# Altium project DIO_8SMA_8MCX.PrjPCB (part 4 of 4)
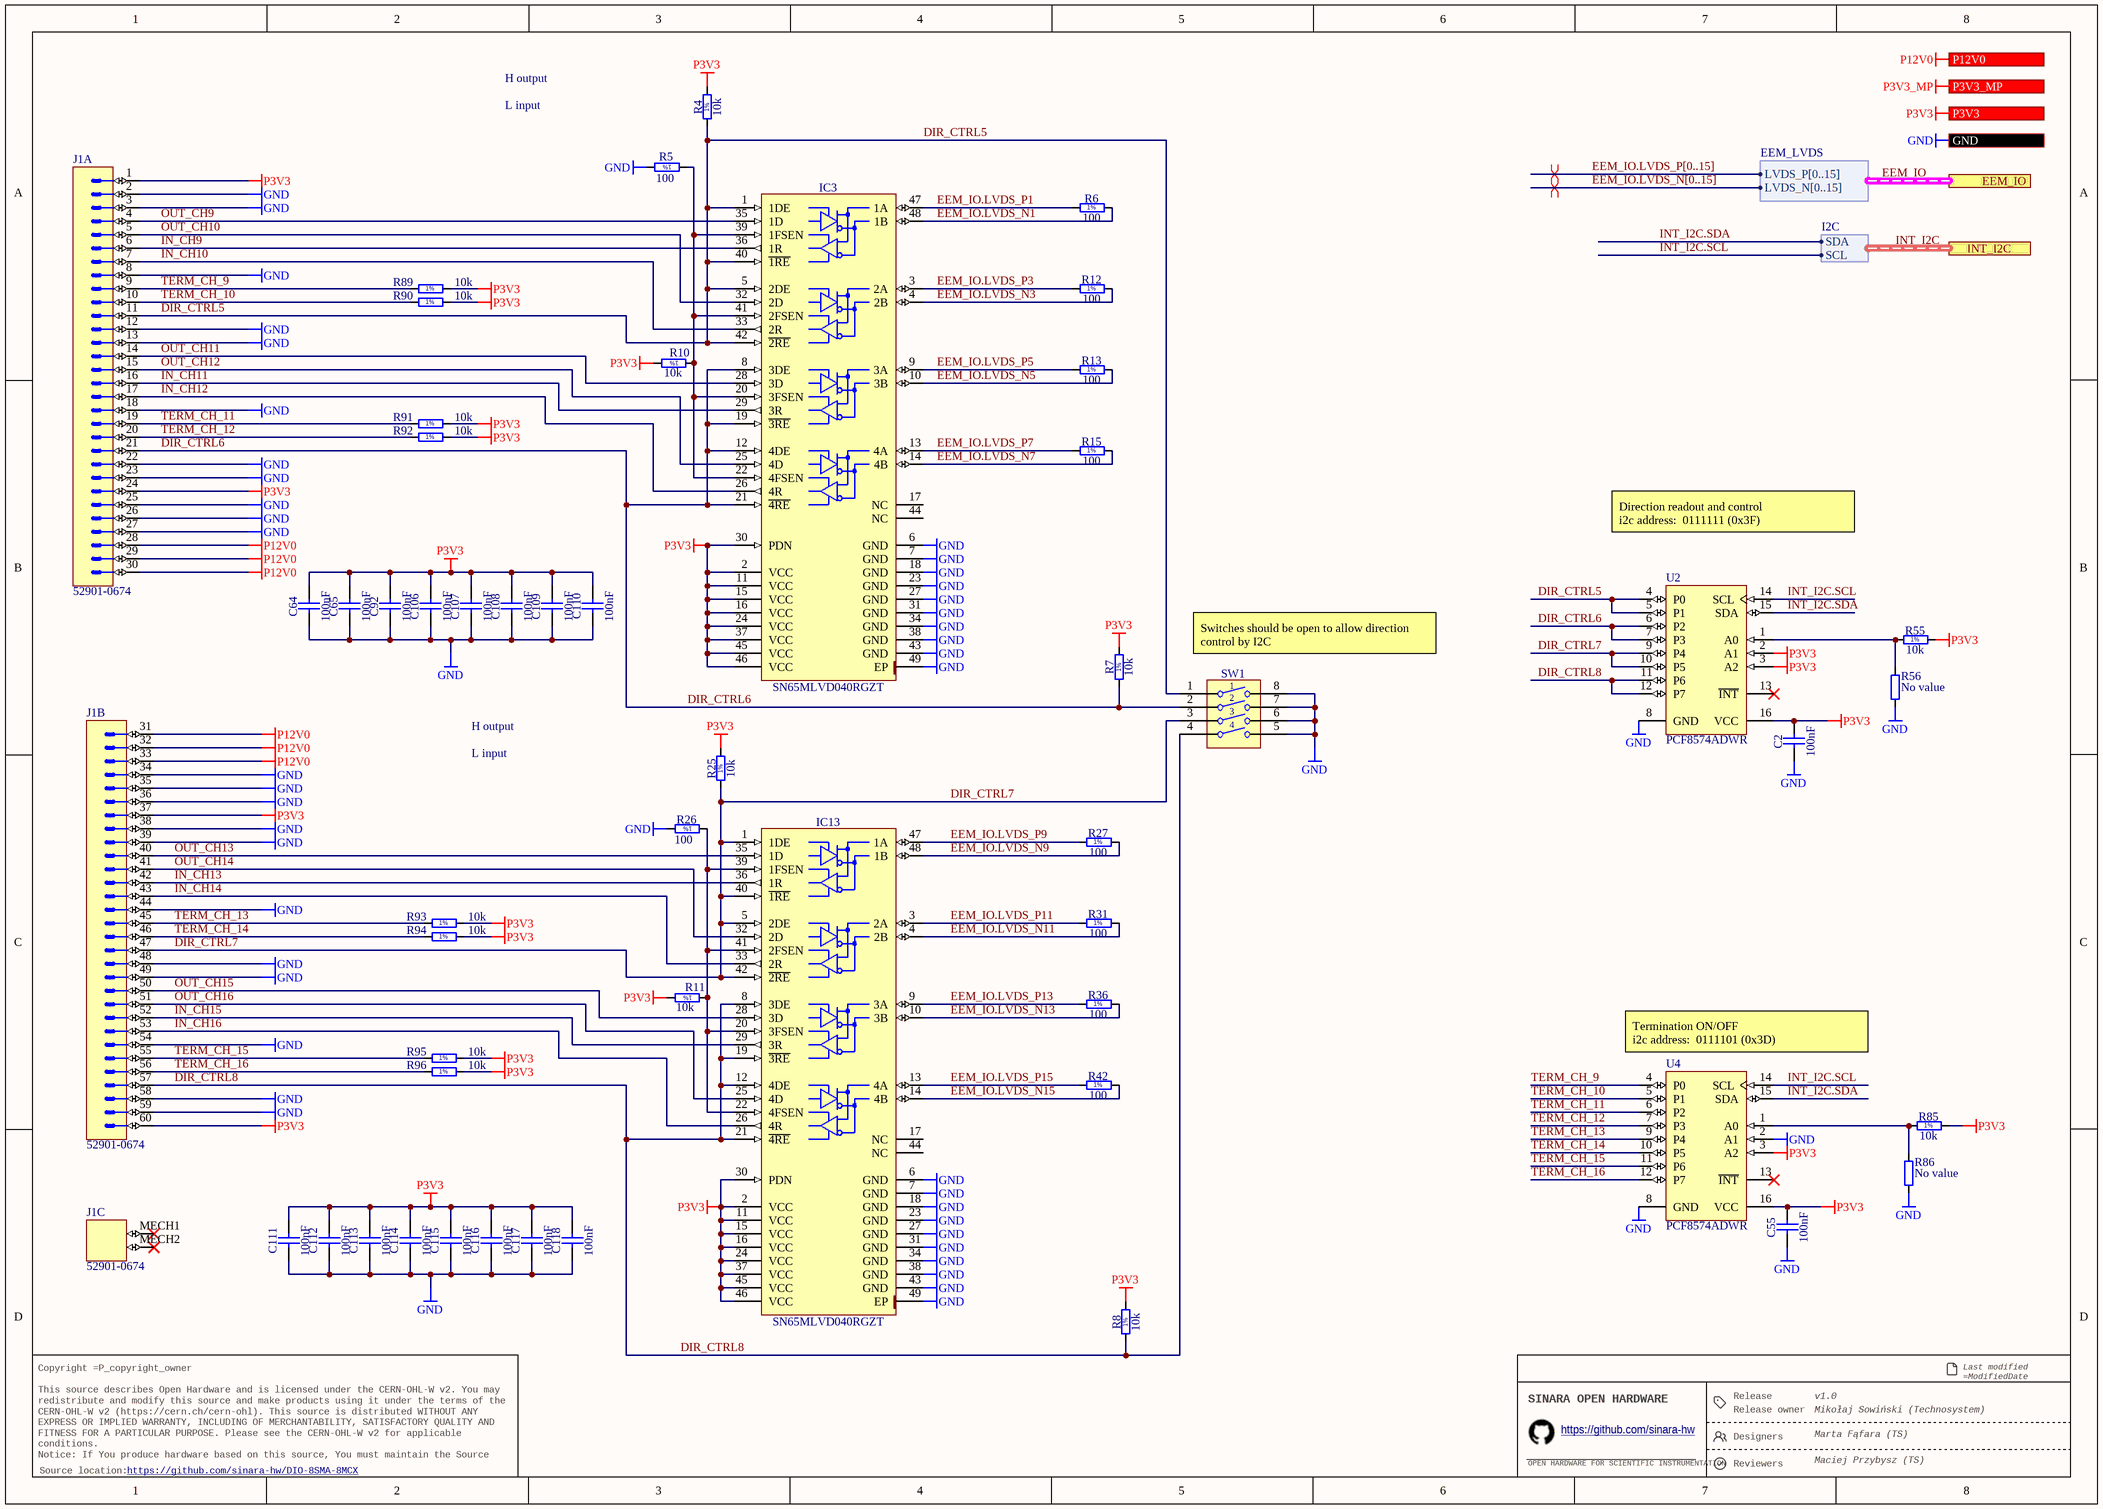
[diagram p17: DIOT_SMA_EXT.schdoc]

## Nets that join several sheets
GND: Power_Supplies (T_C1.1 T_C2.1 T_IC1.2 T_R7.1), Power-up_delay (9 pins), Power_main_DCDC (13 pins), LEDs (5 pins), U_PWR_Supply/U_DIOT_SMA_Supply/ISO_DCDC_1 (5 pins), U_PWR_Supply/U_DIOT_SMA_Supply/ISO_DCDC_2 (5 pins), U_PWR_Supply/U_DIOT_SMA_Supply/ISO_DCDC_3 (5 pins), U_PWR_Supply/U_DIOT_SMA_Supply/ISO_DCDC_4 (5 pins), CPCIS_Connectors_P1_P6 (55 pins), DIOT_signal_routing (T_C22.1 T_C23.1 T_IC8.4), EEM_Connectors (34 pins), Temperature_monitoring (T_C8.1 T_IC6.2 T_R25.1), PWR_input_connector (T_C9.1 T_C10.1 T_D5.2 T_FL1.4), Mechanical (T_C12.2 T_R26.2 T_R27.2), I2C_switch (T_C24.1 T_C25.1 T_IC9.4 T_R69.1), DIOT_SMA_BASE_Split (49 pins), U_DIOT_SMA_BASE/Bank1 (6 pins), U_DIOT_SMA_BASE/Bank2 (6 pins), U_DIOT_SMA_BASE/Bank3 (6 pins), U_DIOT_SMA_BASE/Bank4 (6 pins), DIOT_SMA_EXT (71 pins)
GND_ISO1: U_PWR_Supply/U_DIOT_SMA_Supply/ISO_DCDC_1 (5 pins), U_DIOT_SMA_BASE/Bank1 (33 pins)
GND_ISO2: U_PWR_Supply/U_DIOT_SMA_Supply/ISO_DCDC_2 (5 pins), U_DIOT_SMA_BASE/Bank2 (33 pins)
GND_ISO3: U_PWR_Supply/U_DIOT_SMA_Supply/ISO_DCDC_3 (5 pins), U_DIOT_SMA_BASE/Bank3 (33 pins)
GND_ISO4: U_PWR_Supply/U_DIOT_SMA_Supply/ISO_DCDC_4 (5 pins), U_DIOT_SMA_BASE/Bank4 (33 pins)
P3V3: Power_main_DCDC (5 pins), LEDs (T_R5.2 T_TP2.1), I2C_switch (6 pins), DIOT_SMA_BASE_Split (55 pins), U_DIOT_SMA_BASE/Bank1 (8 pins), U_DIOT_SMA_BASE/Bank2 (8 pins), U_DIOT_SMA_BASE/Bank3 (8 pins), U_DIOT_SMA_BASE/Bank4 (8 pins), DIOT_SMA_EXT (61 pins)
P3V3_MP: Power_Supplies (T_R2.2 T_R8.2), Power-up_delay (6 pins), LEDs (T_R1.2 T_R6.2 T_TP3.1), DIOT_signal_routing (T_C22.2 T_C23.2 T_IC8.1 T_IC8.8), EEM_Connectors (5 pins), Temperature_monitoring (T_C8.2 T_IC6.5), I2C_switch (T_C24.2 T_IC9.8)
P5V0_ISO1: U_PWR_Supply/U_DIOT_SMA_Supply/ISO_DCDC_1 (C42A.1 C43A.2 L5A.1), U_DIOT_SMA_BASE/Bank1 (18 pins)
P5V0_ISO2: U_PWR_Supply/U_DIOT_SMA_Supply/ISO_DCDC_2 (C42B.1 C43B.2 L5B.1), U_DIOT_SMA_BASE/Bank2 (18 pins)
P5V0_ISO3: U_PWR_Supply/U_DIOT_SMA_Supply/ISO_DCDC_3 (C42C.1 C43C.2 L5C.1), U_DIOT_SMA_BASE/Bank3 (18 pins)
P5V0_ISO4: U_PWR_Supply/U_DIOT_SMA_Supply/ISO_DCDC_4 (C42D.1 C43D.2 L5D.1), U_DIOT_SMA_BASE/Bank4 (18 pins)
P12V0: Power_Supplies (T_C1.2 T_IC1.1 T_R4.1), Power-up_delay (T_R29.1), Power_main_DCDC (C86.2 C87.2 IC17.1 R68.2), LEDs (T_R3.1 T_TP1.1), U_PWR_Supply/U_DIOT_SMA_Supply/ISO_DCDC_1 (C39A.1 C41A.2 L11A.2), U_PWR_Supply/U_DIOT_SMA_Supply/ISO_DCDC_2 (C39B.1 C41B.2 L11B.2), U_PWR_Supply/U_DIOT_SMA_Supply/ISO_DCDC_3 (C39C.1 C41C.2 L11C.2), U_PWR_Supply/U_DIOT_SMA_Supply/ISO_DCDC_4 (C39D.1 C41D.2 L11D.2), CPCIS_Connectors_P1_P6 (7 pins), EEM_Connectors (T_J1.28 T_J1.29 T_J2.28 T_J2.29), PWR_input_connector (T_C9.2 T_C10.2 T_D5.1 T_FL1.2), DIOT_SMA_EXT (6 pins)
BP_I2C.SCL: CPCIS_Connectors_P1_P6 (T_D2.3 T_J4.B2), DIOT_signal_routing (T_IC8.6)
BP_I2C.SDA: CPCIS_Connectors_P1_P6 (T_D2.1 T_J4.C2), DIOT_signal_routing (T_IC8.7)
BP_IO.LVDS_N0: CPCIS_Connectors_P1_P6 (T_J4.E3), DIOT_signal_routing (T_R51.1)
BP_IO.LVDS_N1: CPCIS_Connectors_P1_P6 (T_J4.B3), DIOT_signal_routing (T_R52.1)
BP_IO.LVDS_N2: CPCIS_Connectors_P1_P6 (T_J4.C4), DIOT_signal_routing (T_R53.1)
BP_IO.LVDS_N3: CPCIS_Connectors_P1_P6 (T_J4.L4), DIOT_signal_routing (T_R54.1)
BP_IO.LVDS_N4: CPCIS_Connectors_P1_P6 (T_J4.I4), DIOT_signal_routing (T_R55.1)
BP_IO.LVDS_N5: CPCIS_Connectors_P1_P6 (T_J4.K5), DIOT_signal_routing (T_R56.1)
BP_IO.LVDS_N6: CPCIS_Connectors_P1_P6 (T_J4.H5), DIOT_signal_routing (T_R57.1)
BP_IO.LVDS_N7: CPCIS_Connectors_P1_P6 (T_J4.F6), DIOT_signal_routing (T_R58.1)
BP_IO.LVDS_N8: CPCIS_Connectors_P1_P6 (T_J4.C6), DIOT_signal_routing (T_R59.1)
BP_IO.LVDS_N9: CPCIS_Connectors_P1_P6 (T_J4.L6), DIOT_signal_routing (T_R60.1)
BP_IO.LVDS_N10: CPCIS_Connectors_P1_P6 (T_J4.I6), DIOT_signal_routing (T_R61.1)
BP_IO.LVDS_N11: CPCIS_Connectors_P1_P6 (T_J5.E1), DIOT_signal_routing (T_R62.1)
BP_IO.LVDS_N12: CPCIS_Connectors_P1_P6 (T_J5.B1), DIOT_signal_routing (T_R63.1)
BP_IO.LVDS_N13: CPCIS_Connectors_P1_P6 (T_J5.K1), DIOT_signal_routing (T_R64.1)
BP_IO.LVDS_N14: CPCIS_Connectors_P1_P6 (T_J5.H1), DIOT_signal_routing (T_R65.1)
BP_IO.LVDS_N15: CPCIS_Connectors_P1_P6 (T_J4.F2), DIOT_signal_routing (T_R66.2)
BP_IO.LVDS_P0: CPCIS_Connectors_P1_P6 (T_J4.D3), DIOT_signal_routing (T_R35.1)
BP_IO.LVDS_P1: CPCIS_Connectors_P1_P6 (T_J4.A3), DIOT_signal_routing (T_R36.1)
BP_IO.LVDS_P2: CPCIS_Connectors_P1_P6 (T_J4.B4), DIOT_signal_routing (T_R37.1)
BP_IO.LVDS_P3: CPCIS_Connectors_P1_P6 (T_J4.K4), DIOT_signal_routing (T_R38.1)
BP_IO.LVDS_P4: CPCIS_Connectors_P1_P6 (T_J4.H4), DIOT_signal_routing (T_R39.1)
BP_IO.LVDS_P5: CPCIS_Connectors_P1_P6 (T_J4.J5), DIOT_signal_routing (T_R40.1)
BP_IO.LVDS_P6: CPCIS_Connectors_P1_P6 (T_J4.G5), DIOT_signal_routing (T_R41.1)
BP_IO.LVDS_P7: CPCIS_Connectors_P1_P6 (T_J4.E6), DIOT_signal_routing (T_R42.1)
BP_IO.LVDS_P8: CPCIS_Connectors_P1_P6 (T_J4.B6), DIOT_signal_routing (T_R43.1)
BP_IO.LVDS_P9: CPCIS_Connectors_P1_P6 (T_J4.K6), DIOT_signal_routing (T_R44.1)
BP_IO.LVDS_P10: CPCIS_Connectors_P1_P6 (T_J4.H6), DIOT_signal_routing (T_R45.1)
BP_IO.LVDS_P11: CPCIS_Connectors_P1_P6 (T_J5.D1), DIOT_signal_routing (T_R46.1)
BP_IO.LVDS_P12: CPCIS_Connectors_P1_P6 (T_J5.A1), DIOT_signal_routing (T_R47.1)
BP_IO.LVDS_P13: CPCIS_Connectors_P1_P6 (T_J5.J1), DIOT_signal_routing (T_R48.1)
BP_IO.LVDS_P14: CPCIS_Connectors_P1_P6 (T_J5.G1), DIOT_signal_routing (T_R49.1)
BP_IO.LVDS_P15: CPCIS_Connectors_P1_P6 (T_J4.E2), DIOT_signal_routing (T_R50.2)
DIR_CTRL1: DIOT_SMA_BASE_Split (8 pins), U_DIOT_SMA_BASE/Bank1 (IC54A.3)
DIR_CTRL2: DIOT_SMA_BASE_Split (8 pins), U_DIOT_SMA_BASE/Bank2 (IC54B.3)
DIR_CTRL3: DIOT_SMA_BASE_Split (8 pins), U_DIOT_SMA_BASE/Bank3 (IC54C.3)
DIR_CTRL4: DIOT_SMA_BASE_Split (8 pins), U_DIOT_SMA_BASE/Bank4 (IC54D.3)
EEM0_I2C.SCL: DIOT_signal_routing (T_IC8.3), Temperature_monitoring (T_IC6.1), I2C_switch (T_IC9.6)
EEM0_I2C.SDA: DIOT_signal_routing (T_IC8.2), Temperature_monitoring (T_IC6.6), I2C_switch (T_IC9.7)
EEM_IO.LVDS_N0: DIOT_signal_routing (T_R51.2), DIOT_SMA_BASE_Split (IC32.48 R64.2)
EEM_IO.LVDS_N1: DIOT_signal_routing (T_R52.2), DIOT_SMA_EXT (IC3.48 R6.2)
EEM_IO.LVDS_N2: DIOT_signal_routing (T_R53.2), DIOT_SMA_BASE_Split (IC32.4 R71.2)
EEM_IO.LVDS_N3: DIOT_signal_routing (T_R54.2), DIOT_SMA_EXT (IC3.4 R12.2)
EEM_IO.LVDS_N4: DIOT_signal_routing (T_R55.2), DIOT_SMA_BASE_Split (IC32.10 R76.2)
EEM_IO.LVDS_N5: DIOT_signal_routing (T_R56.2), DIOT_SMA_EXT (IC3.10 R13.2)
EEM_IO.LVDS_N6: DIOT_signal_routing (T_R57.2), DIOT_SMA_BASE_Split (IC32.14 R82.2)
EEM_IO.LVDS_N7: DIOT_signal_routing (T_R58.2), DIOT_SMA_EXT (IC3.14 R15.2)
EEM_IO.LVDS_N8: DIOT_signal_routing (T_R59.2), DIOT_SMA_BASE_Split (IC46.48 R106.2)
EEM_IO.LVDS_N9: DIOT_signal_routing (T_R60.2), DIOT_SMA_EXT (IC13.48 R27.2)
EEM_IO.LVDS_N10: DIOT_signal_routing (T_R61.2), DIOT_SMA_BASE_Split (IC46.4 R114.2)
EEM_IO.LVDS_N11: DIOT_signal_routing (T_R62.2), DIOT_SMA_EXT (IC13.4 R31.2)
EEM_IO.LVDS_N12: DIOT_signal_routing (T_R63.2), DIOT_SMA_BASE_Split (IC46.10 R121.2)
EEM_IO.LVDS_N13: DIOT_signal_routing (T_R64.2), DIOT_SMA_EXT (IC13.10 R36.2)
EEM_IO.LVDS_N14: DIOT_signal_routing (T_R65.2), DIOT_SMA_BASE_Split (IC46.14 R129.2)
EEM_IO.LVDS_N15: DIOT_signal_routing (T_R66.1), DIOT_SMA_EXT (IC13.14 R42.2)
EEM_IO.LVDS_P0: DIOT_signal_routing (T_R35.2), DIOT_SMA_BASE_Split (IC32.47 R64.1)
EEM_IO.LVDS_P1: DIOT_signal_routing (T_R36.2), DIOT_SMA_EXT (IC3.47 R6.1)
EEM_IO.LVDS_P2: DIOT_signal_routing (T_R37.2), DIOT_SMA_BASE_Split (IC32.3 R71.1)
EEM_IO.LVDS_P3: DIOT_signal_routing (T_R38.2), DIOT_SMA_EXT (IC3.3 R12.1)
EEM_IO.LVDS_P4: DIOT_signal_routing (T_R39.2), DIOT_SMA_BASE_Split (IC32.9 R76.1)
EEM_IO.LVDS_P5: DIOT_signal_routing (T_R40.2), DIOT_SMA_EXT (IC3.9 R13.1)
EEM_IO.LVDS_P6: DIOT_signal_routing (T_R41.2), DIOT_SMA_BASE_Split (IC32.13 R82.1)
EEM_IO.LVDS_P7: DIOT_signal_routing (T_R42.2), DIOT_SMA_EXT (IC3.13 R15.1)
EEM_IO.LVDS_P8: DIOT_signal_routing (T_R43.2), DIOT_SMA_BASE_Split (IC46.47 R106.1)
EEM_IO.LVDS_P9: DIOT_signal_routing (T_R44.2), DIOT_SMA_EXT (IC13.47 R27.1)
EEM_IO.LVDS_P10: DIOT_signal_routing (T_R45.2), DIOT_SMA_BASE_Split (IC46.3 R114.1)
EEM_IO.LVDS_P11: DIOT_signal_routing (T_R46.2), DIOT_SMA_EXT (IC13.3 R31.1)
EEM_IO.LVDS_P12: DIOT_signal_routing (T_R47.2), DIOT_SMA_BASE_Split (IC46.9 R121.1)
EEM_IO.LVDS_P13: DIOT_signal_routing (T_R48.2), DIOT_SMA_EXT (IC13.9 R36.1)
EEM_IO.LVDS_P14: DIOT_signal_routing (T_R49.2), DIOT_SMA_BASE_Split (IC46.13 R129.1)
EEM_IO.LVDS_P15: DIOT_signal_routing (T_R50.1), DIOT_SMA_EXT (IC13.13 R42.1)
GA0: Power-up_delay (T_R31.1 T_T2.1), CPCIS_Connectors_P1_P6 (T_R13.1)
GA1: Power-up_delay (T_R32.1 T_T3.1), CPCIS_Connectors_P1_P6 (T_R14.1)
GA2: Power-up_delay (T_R33.1 T_T4.1), CPCIS_Connectors_P1_P6 (T_R16.1)
GA3: Power-up_delay (T_R34.1 T_T5.1), CPCIS_Connectors_P1_P6 (T_R18.1)
I2C_A.SCL: I2C_switch (T_IC9.3 T_R68.1), DIOT_SMA_BASE_Split (U1.14 U3.14), DIOT_SMA_EXT (U2.14 U4.14)
I2C_A.SDA: I2C_switch (T_IC9.2 T_R67.1), DIOT_SMA_BASE_Split (U1.15 U3.15), DIOT_SMA_EXT (U2.15 U4.15)
NetB5A_1: DIOT_SMA_BASE_Split (IC32.35), U_DIOT_SMA_BASE/Bank1 (B5A.1 IC52A.12)
NetB5B_1: DIOT_SMA_BASE_Split (IC32.28), U_DIOT_SMA_BASE/Bank2 (B5B.1 IC52B.12)
NetB5C_1: DIOT_SMA_BASE_Split (IC46.35), U_DIOT_SMA_BASE/Bank3 (B5C.1 IC52C.12)
NetB5D_1: DIOT_SMA_BASE_Split (IC46.28), U_DIOT_SMA_BASE/Bank4 (B5D.1 IC52D.12)
NetB7A_1: DIOT_SMA_BASE_Split (IC32.32), U_DIOT_SMA_BASE/Bank1 (B7A.1 IC52A.11)
NetB7B_1: DIOT_SMA_BASE_Split (IC32.25), U_DIOT_SMA_BASE/Bank2 (B7B.1 IC52B.11)
NetB7C_1: DIOT_SMA_BASE_Split (IC46.32), U_DIOT_SMA_BASE/Bank3 (B7C.1 IC52C.11)
NetB7D_1: DIOT_SMA_BASE_Split (IC46.25), U_DIOT_SMA_BASE/Bank4 (B7D.1 IC52D.11)
NetB8A_1: DIOT_SMA_BASE_Split (IC32.36), U_DIOT_SMA_BASE/Bank1 (B8A.1 IC53A.5)
NetB8B_1: DIOT_SMA_BASE_Split (IC32.29), U_DIOT_SMA_BASE/Bank2 (B8B.1 IC53B.5)
NetB8C_1: DIOT_SMA_BASE_Split (IC46.36), U_DIOT_SMA_BASE/Bank3 (B8C.1 IC53C.5)
NetB8D_1: DIOT_SMA_BASE_Split (IC46.29), U_DIOT_SMA_BASE/Bank4 (B8D.1 IC53D.5)
NetB9A_1: DIOT_SMA_BASE_Split (IC32.33), U_DIOT_SMA_BASE/Bank1 (B9A.1 IC53A.6)
NetB9B_1: DIOT_SMA_BASE_Split (IC32.26), U_DIOT_SMA_BASE/Bank2 (B9B.1 IC53B.6)
NetB9C_1: DIOT_SMA_BASE_Split (IC46.33), U_DIOT_SMA_BASE/Bank3 (B9C.1 IC53C.6)
NetB9D_1: DIOT_SMA_BASE_Split (IC46.26), U_DIOT_SMA_BASE/Bank4 (B9D.1 IC53D.6)
PGOOD: Power_main_DCDC (IC17.7 R1.1), LEDs (T_T1.1 T_TP4.1)
PSU_EN: Power_Supplies (T_R8.1), Power-up_delay (T_IC7.1), Power_main_DCDC (IC17.8), LEDs (T_LD1.1 T_TP8.1), Temperature_monitoring (T_IC6.3)
RSTn: Power-up_delay (T_D6.1), CPCIS_Connectors_P1_P6 (T_R15.1)
SERVMOD_3V3: CPCIS_Connectors_P1_P6 (T_R17.1 T_R19.2), DIOT_signal_routing (T_IC8.5)
TERM_CH_1: DIOT_SMA_BASE_Split (R17.1 U3.4), U_DIOT_SMA_BASE/Bank1 (IC10A.4)
TERM_CH_2: DIOT_SMA_BASE_Split (R18.1 U3.5), U_DIOT_SMA_BASE/Bank1 (IC10A.2)
TERM_CH_3: DIOT_SMA_BASE_Split (R19.1 U3.6), U_DIOT_SMA_BASE/Bank2 (IC10B.4)
TERM_CH_4: DIOT_SMA_BASE_Split (R20.1 U3.7), U_DIOT_SMA_BASE/Bank2 (IC10B.2)
TERM_CH_5: DIOT_SMA_BASE_Split (R21.1 U3.9), U_DIOT_SMA_BASE/Bank3 (IC10C.4)
TERM_CH_6: DIOT_SMA_BASE_Split (R22.1 U3.10), U_DIOT_SMA_BASE/Bank3 (IC10C.2)
TERM_CH_7: DIOT_SMA_BASE_Split (R23.1 U3.11), U_DIOT_SMA_BASE/Bank4 (IC10D.4)
TERM_CH_8: DIOT_SMA_BASE_Split (R24.1 U3.12), U_DIOT_SMA_BASE/Bank4 (IC10D.2)

## Assembly variants
EEM: not fitted IC12A IC12B IC12C IC12D L9 R3 R9 R10 R11 R69A R69B R69C R69D T_IC3 T_IC5 T_J4 T_J5 T_R2 T_R4 T_R35 T_R36 T_R37 T_R38 T_R39 T_R40 T_R41 T_R42 T_R43 T_R44 T_R45 T_R46 T_R47 T_R48 T_R49 T_R50 T_R51 T_R52 T_R53 T_R54 T_R55 T_R56 T_R57 T_R58 T_R59 T_R60 T_R61 T_R62 T_R63 T_R64 T_R65 T_R66; alternate parts T_R26 -> R0805_0R_JUMPER
DIOT: not fitted IC12A IC12B IC12C IC12D L9 R3 R9 R10 R11 R69A R69B R69C R69D T_IC3 T_IC5 T_J1 T_J2